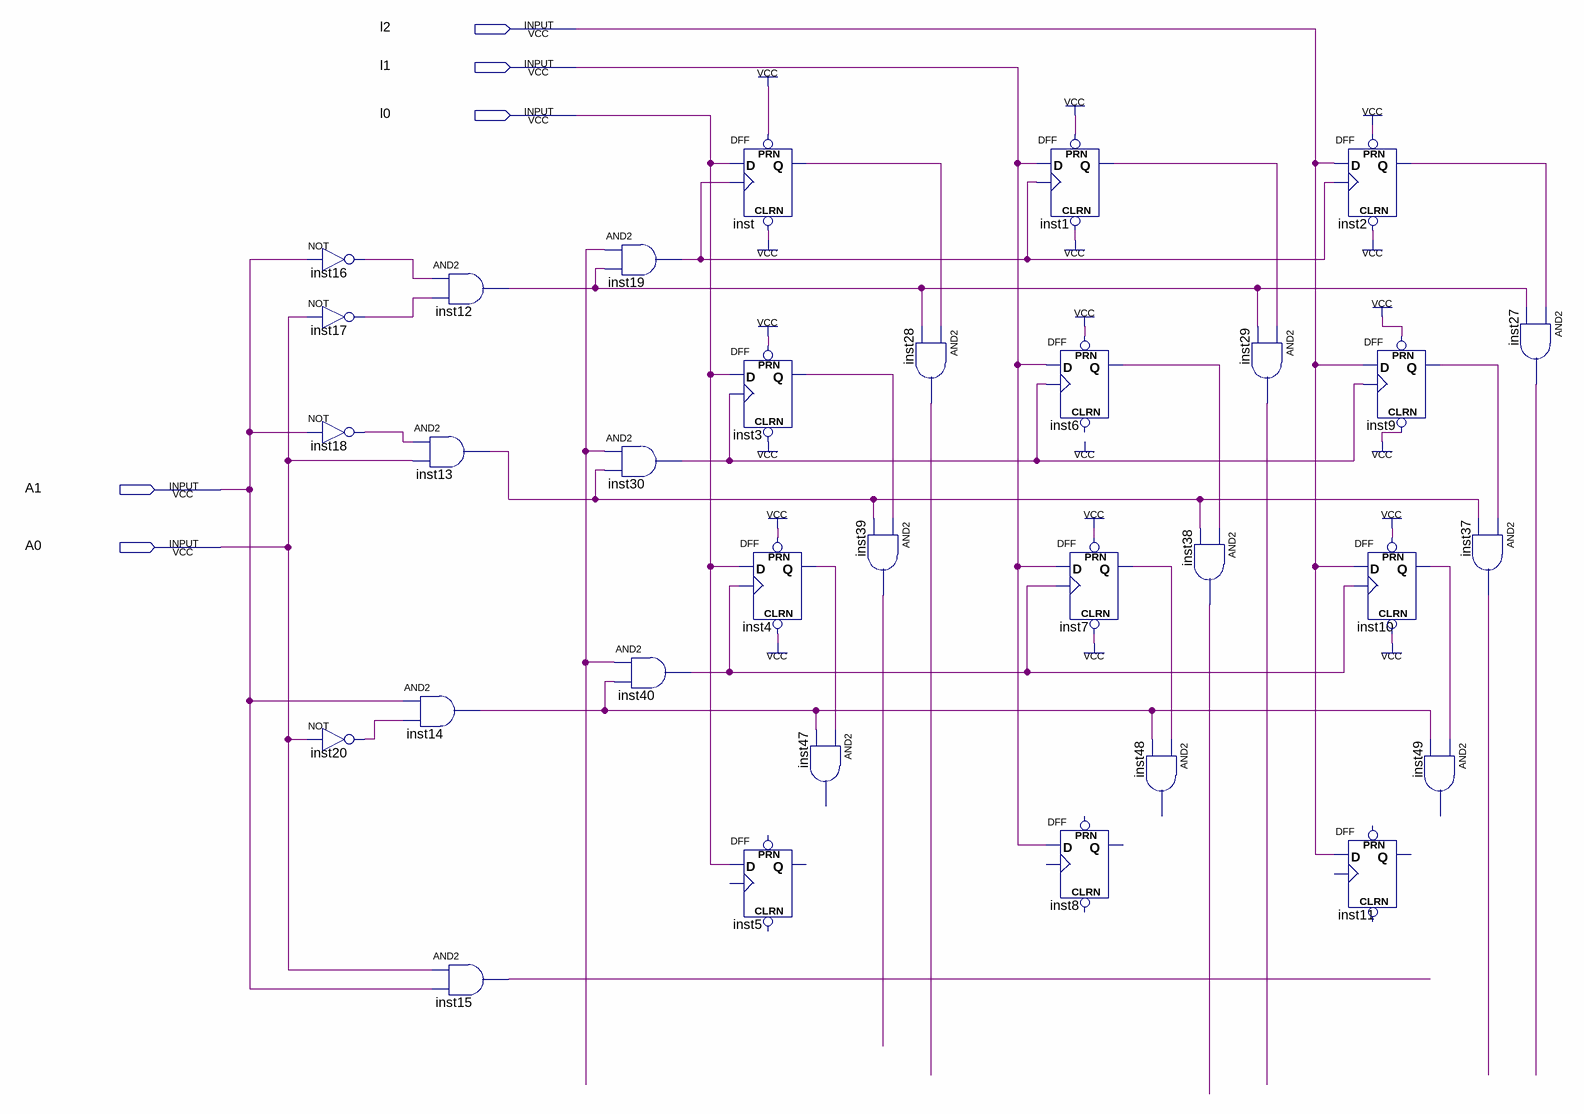
[diagram p0: schematic sheet]
// Quartus schematic mem_4x3.bdf as structural Verilog: 32 symbols, 5 pins
module mem_4x3 (
  input  l2,
  input  l1,
  input  l0,
  input  A1,
  input  A0
);

  wire inst1_q, inst2_q, inst3_q, inst4_q, inst6_q, inst7_q, inst9_q, inst10_q, inst12_out, inst13_out,
       inst14_out, inst15_out, inst16_out, inst17_out, inst18_out, inst19_out, inst20_out, inst27_out,
       inst28_out, inst29_out, inst30_out, inst37_out, inst38_out, inst39_out, inst40_out, inst_q, undriven;

  not inst16 (inst16_out, A1);
  not inst17 (inst17_out, A0);
  not inst18 (inst18_out, A1);
  not inst20 (inst20_out, A0);
  and inst12 (inst12_out, inst16_out, inst17_out);
  and inst13 (inst13_out, inst18_out, A0);
  and inst14 (inst14_out, A1, inst20_out);
  and inst15 (inst15_out, A0, A1);
  and inst19 (inst19_out, undriven, inst12_out);
  and inst30 (inst30_out, undriven, inst13_out);
  and inst40 (inst40_out, undriven, inst14_out);
  DFF inst (.CLRN(1'b1), .CLK(inst19_out), .D(l0), .PRN(1'b1), .Q(inst_q));
  DFF inst3 (.CLRN(1'b1), .CLK(inst30_out), .D(l0), .PRN(1'b1), .Q(inst3_q));
  DFF inst4 (.CLRN(1'b1), .CLK(inst40_out), .D(l0), .PRN(1'b1), .Q(inst4_q));
  DFF inst5 (.D(l0));  // open: CLRN, CLK, PRN, Q
  // AND2 inst47 has open pins: IN1=inst4_q, IN2=inst14_out, OUT=open
  and inst28 (inst28_out, inst_q, inst12_out);
  and inst39 (inst39_out, inst3_q, inst13_out);
  DFF inst1 (.CLRN(1'b1), .CLK(inst19_out), .D(l1), .PRN(1'b1), .Q(inst1_q));
  DFF inst6 (.CLK(inst30_out), .D(l1), .PRN(1'b1), .Q(inst6_q));  // open: CLRN
  DFF inst7 (.CLRN(1'b1), .CLK(inst40_out), .D(l1), .PRN(1'b1), .Q(inst7_q));
  DFF inst8 (.D(l1));  // open: CLRN, CLK, PRN, Q
  // AND2 inst48 has open pins: IN1=inst7_q, IN2=inst14_out, OUT=open
  and inst38 (inst38_out, inst6_q, inst13_out);
  and inst29 (inst29_out, inst1_q, inst12_out);
  DFF inst2 (.CLRN(1'b1), .CLK(inst19_out), .D(l2), .PRN(1'b1), .Q(inst2_q));
  DFF inst9 (.CLRN(1'b1), .CLK(inst30_out), .D(l2), .PRN(1'b1), .Q(inst9_q));
  DFF inst10 (.CLRN(1'b1), .CLK(inst40_out), .D(l2), .PRN(1'b1), .Q(inst10_q));
  DFF inst11 (.D(l2));  // open: CLRN, CLK, PRN, Q
  // AND2 inst49 has open pins: IN1=inst10_q, IN2=inst14_out, OUT=open
  and inst27 (inst27_out, inst2_q, inst12_out);
  and inst37 (inst37_out, inst9_q, inst13_out);
endmodule
